# EAGLE design RS232 rev3 (EAGLE 7.1.0)
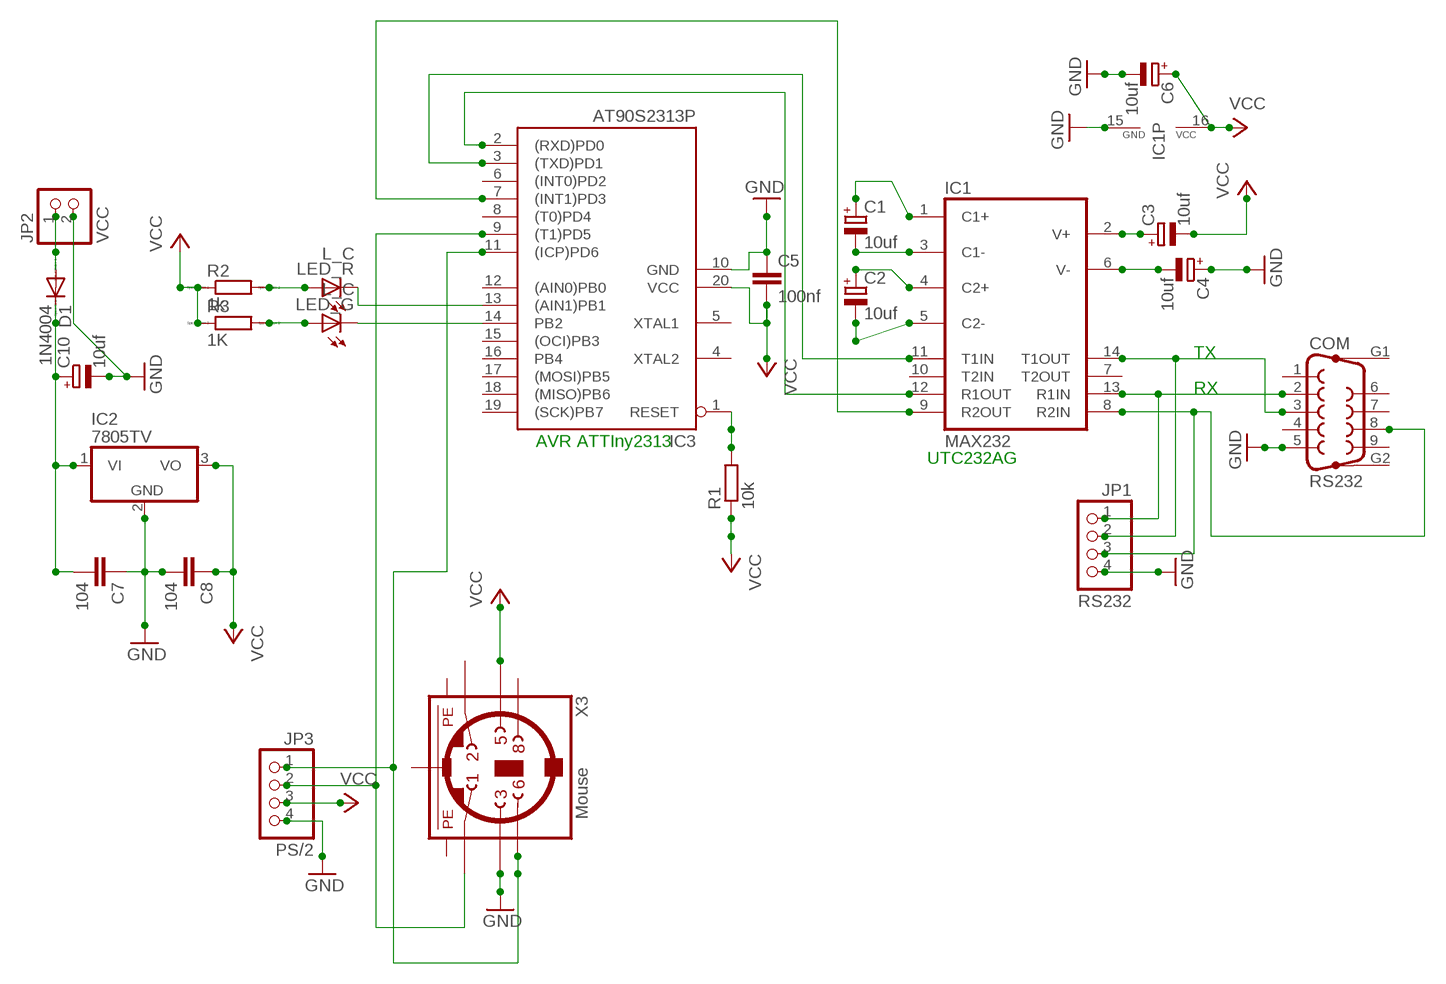
[diagram p0: schematic, sheet 1]

## Parts
C1  10uf  CPOL-EUE2,5-6E  [E2,5-6E]
C2  10uf  CPOL-EUE2,5-6E  [E2,5-6E]
C3  10uf  CPOL-EUE2,5-6E  [E2,5-6E]
C4  10uf  CPOL-EUE2,5-6E  [E2,5-6E]
C5  100nf  C2,5-3  [C2.5-3]
C6  10uf  CPOL-EUE2,5-6E  [E2,5-6E]
C7  104  C-EU025-025X050  [C025-025X050]
C8  104  C-EU025-025X050  [C025-025X050]
C10  10uf  CPOL-EUE2,5-6E  [E2,5-6E]
COM  RS232  F09HP  [F09HP]
D1  1N4004  [DO41-10]
IC1  MAX232  [DIL16]
IC2  7805TV  [TO220V]
IC3  AT90S2313P  [DIL20]
JP1  RS232  PINHD-1X4  [1X04]
JP2  VCC  PINHD-1X2  [1X02]
JP3  PS/2  PINHD-1X4  [1X04]
LED_G  L_C  LED3MM  [LED3MM]
LED_R  L_C  LED3MM  [LED3MM]
R1  10k  R-EU_0207/7  [0207/7]
R2  1k  R-EU_0309_V  [0309V]
R3  1K  R-EU_0309_V  [0309V]
X3  Mouse  MINI_DIN_6  [M_DIN6]

## Nets
GND: C4.+ C5.1 C6.- C7.1 C8.2 C10.- COM.5 IC1.15(GND) IC2.2(GND) IC3.10(GND) JP1.4 JP2.2 JP3.4 X3.3
N$1: IC1.11(T1IN) IC3.3((TXD)PD1)
N$2: IC1.12(R1OUT) IC3.2((RXD)PD0)
N$3: C1.- IC1.3(C1-)
N$4: C1.+ IC1.1(C1+)
N$5: C2.+ IC1.4(C2+)
N$6: C2.- IC1.5(C2-)
N$7: IC3.1(RESET) R1.2
N$8: IC3.11((ICP)PD6) JP3.1 X3.6
N$10: C7.2 C10.+ D1.C IC2.1(VI)
N$11: IC1.9(R2OUT) IC3.7((INT1)PD3)
N$13: IC3.14(PB2) LED_G.K(C)
N$14: C4.- IC1.6(V-)
N$15: C3.+ IC1.2(V+)
N$16: IC3.13((AIN1)PB1) LED_R.K(C)
N$17: COM.2 IC1.13(R1IN) JP1.1
N$18: COM.3 IC1.14(T1OUT) JP1.2
N$20: LED_G.A R3.2
N$21: LED_R.A R2.2
N$22: IC3.9((T1)PD5) JP3.2 X3.1
POWER: D1.A JP2.1
SERIAL#: COM.8 IC1.8(R2IN) JP1.3
VCC: C3.- C5.2 C6.+ C8.1 IC1.16(VCC) IC2.3(VO) IC3.20(VCC) JP3.3 R1.1 R2.1 R3.1 X3.5
Unconnected: COM.1 COM.4 COM.6 COM.7 COM.9 COM.G1 COM.G2 IC1.7(T2OUT) IC1.10(T2IN) IC3.4(XTAL2) IC3.5(XTAL1) IC3.6((INT0)PD2) IC3.8((T0)PD4) IC3.12((AIN0)PB0) IC3.15((OCI)PB3) IC3.16(PB4) IC3.17((MOSI)PB5) IC3.18((MISO)PB6) IC3.19((SCK)PB7) X3.2 X3.8

## Notes on the sheet
- TX
- RX
- AVR ATTIny2313
- UTC232AG

## Power pins joined to a net without a drawn wire
PE1: X3.SH1(PE1)
PE2: X3.SH2(PE2)
PE3: X3.SH3(PE3)

## Library data of the parts
C1-C4 C6 C10 = resistor:CPOL-EU: POLARIZED CAPACITOR, European symbol
C5 = capacitor-wima:C: CAPACITOR naming: grid - package width
C7 C8 = rcl:C-EU: CAPACITOR, European symbol
COM = con-subd:F09HP: SUB-D; OC_FARNELL: unknown; OC_NEWARK: unknown
D1 = diode:1N4004: DIODE general purpose rectifier, 1 A
IC1 = maxim:MAX232: RS232 TRANSCEIVER; MF: MAXIM; MPN: MAX232ACPE+; OC_FARNELL: 9723773; OC_NEWARK: 68K4544
IC2 = linear:78*: Positive VOLTAGE REGULATOR Source: http://cache.national.com/ds/LM/LM78L05.pdf http://www.fairchildsemi.com/ds/LM/LM7805.pdf
IC3 = atmel:AT90S2313: MICROCONTROLLER 2 Kbytes FLASH 128 bytes SRAM 128 bytes EEPROM UART; OC_FARNELL: unknown; OC_NEWARK: unknown
JP1 JP3 = pinhead:PINHD-1X4: PIN HEADER
JP2 = pinhead:PINHD-1X2: PIN HEADER
LED_G LED_R = led:LED: LED OSRAM: - CHIPLED LG R971, LG N971, LY N971, LG Q971, LY Q971, LO R971, LY R971 LH N974, LH R974 LS Q976, LO Q976, LY Q976 LO Q996 - Hyper CHIPLED LW Q18S LB Q993, LB Q99A, LB R99A - SideLED LS A670, LO A670, LY A670, LG A670, LP A670 LB A673, LV A673, LT A673, LW A673 LH A674 LY A675 LS A676, LA A676, LO A676, LY A676, LW A676 LS A679, LY A679, LG A679 - Hyper Micro SIDELED® LS Y876, LA Y876, LO Y876, LY Y876 LT Y87S - SmartLED LW L88C, LW L88S LB L89C, LB L89S, LG L890 LS L89K, LO L89K, LY L89K LS L896, LA L896, LO L896, LY L896 - TOPLED LS T670, LO T670, LY T670, LG T670, LP T670 LSG T670, LSP T670, LSY T670, LOP T670, LYG T670 LG T671, LOG T671, LSG T671 LB T673, LV T673, LT T673, LW T673 LH T674 LS T676, LA T676, LO T676, LY T676, LB T676, LH T676, LSB T676, LW T676 LB T67C, LV T67C, LT T67C, LS T67K, LO T67K, LY T67K, LW E67C LS E67B, LA E67B, LO E67B, LY E67B, LB E67C, LV E67C, LT E67C LW T67C LS T679, LY T679, LG T679 LS T770, LO T770, LY T770, LG T770, LP T770 LB T773, LV T773, LT T773, LW T773 LH T774 LS E675, LA E675, LY E675, LS T675 LS T776, LA T776, LO T776, LY T776, LB T776 LHGB T686 LT T68C, LB T68C - Hyper Mini TOPLED® LB M676 - Mini TOPLED Santana® LG M470 LS M47K, LO M47K, LY M47K Source: http://www.osram.convergy.de LUXEON: - LUMILED® LXK2-PW12-R00, LXK2-PW12-S00, LXK2-PW14-U00, LXK2-PW14-V00 LXK2-PM12-R00, LXK2-PM12-S00, LXK2-PM14-U00 LXK2-PE12-Q00, LXK2-PE12-R00, LXK2-PE12-S00, LXK2-PE14-T00, LXK2-PE14-U00 LXK2-PB12-K00, LXK2-PB12-L00, LXK2-PB12-M00, LXK2-PB14-N00, LXK2-PB14-P00, LXK2-PB14-Q00 LXK2-PR12-L00, LXK2-PR12-M00, LXK2-PR14-Q00, LXK2-PR14-R00 LXK2-PD12-Q00, LXK2-PD12-R00, LXK2-PD12-S00 LXK2-PH12-R00, LXK2-PH12-S00 LXK2-PL12-P00, LXK2-PL12-Q00, LXK2-PL12-R00 Source: www.luxeon.com KINGBRIGHT: KA-3528ASYC Source: www.kingbright.com
R1 = rcl:R-EU_: RESISTOR, European symbol
R2 R3 = resistor:R-EU_: RESISTOR, European symbol; SPICEPREFIX: R
X3 = mini_din:MINI_DIN_6

## Board
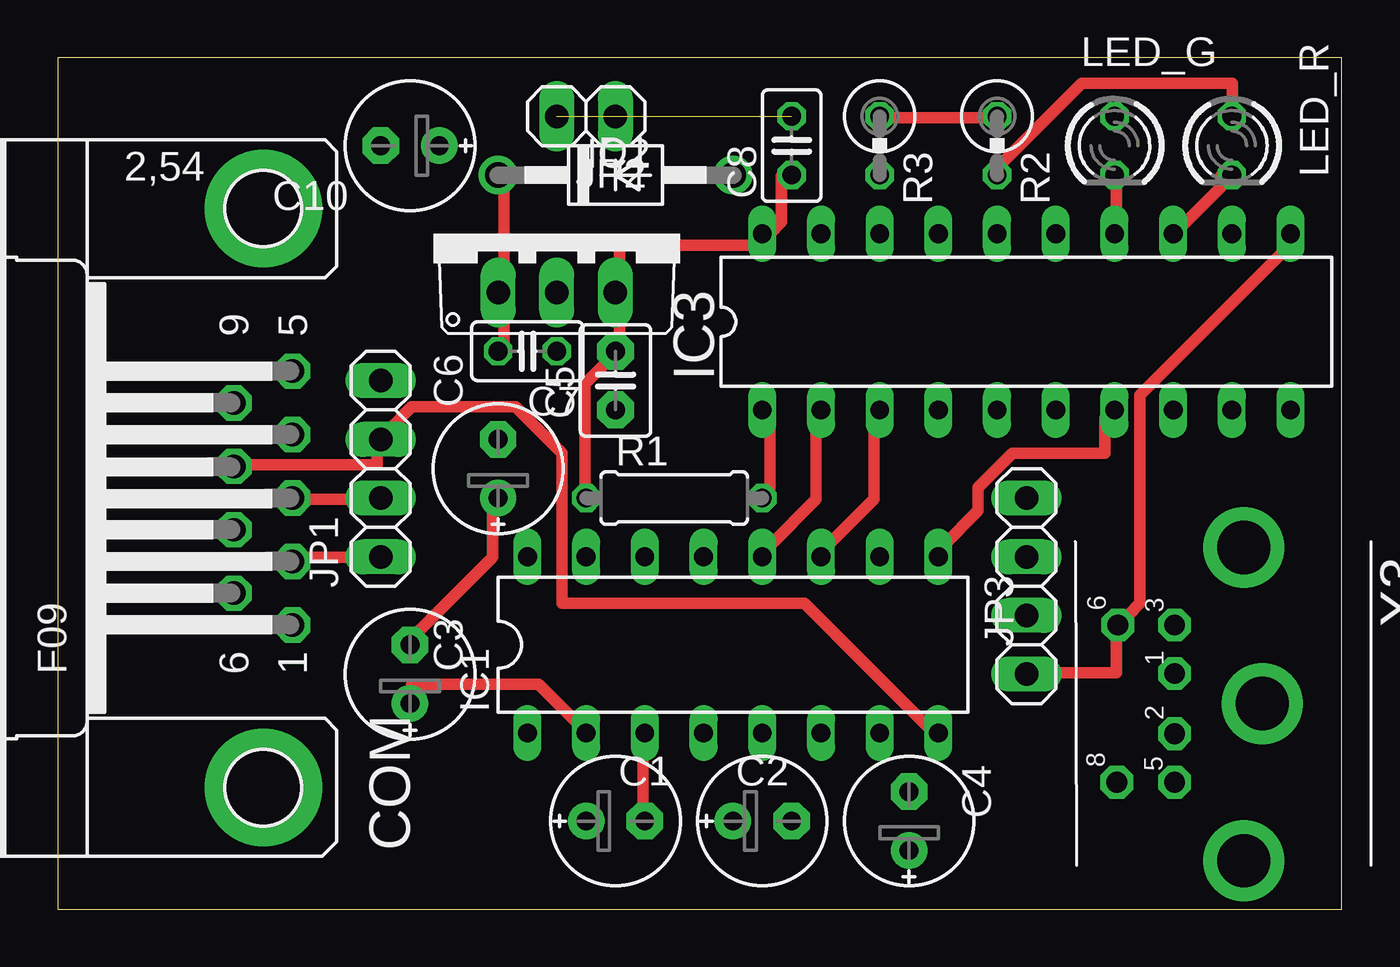
[diagram p1: board, top side]
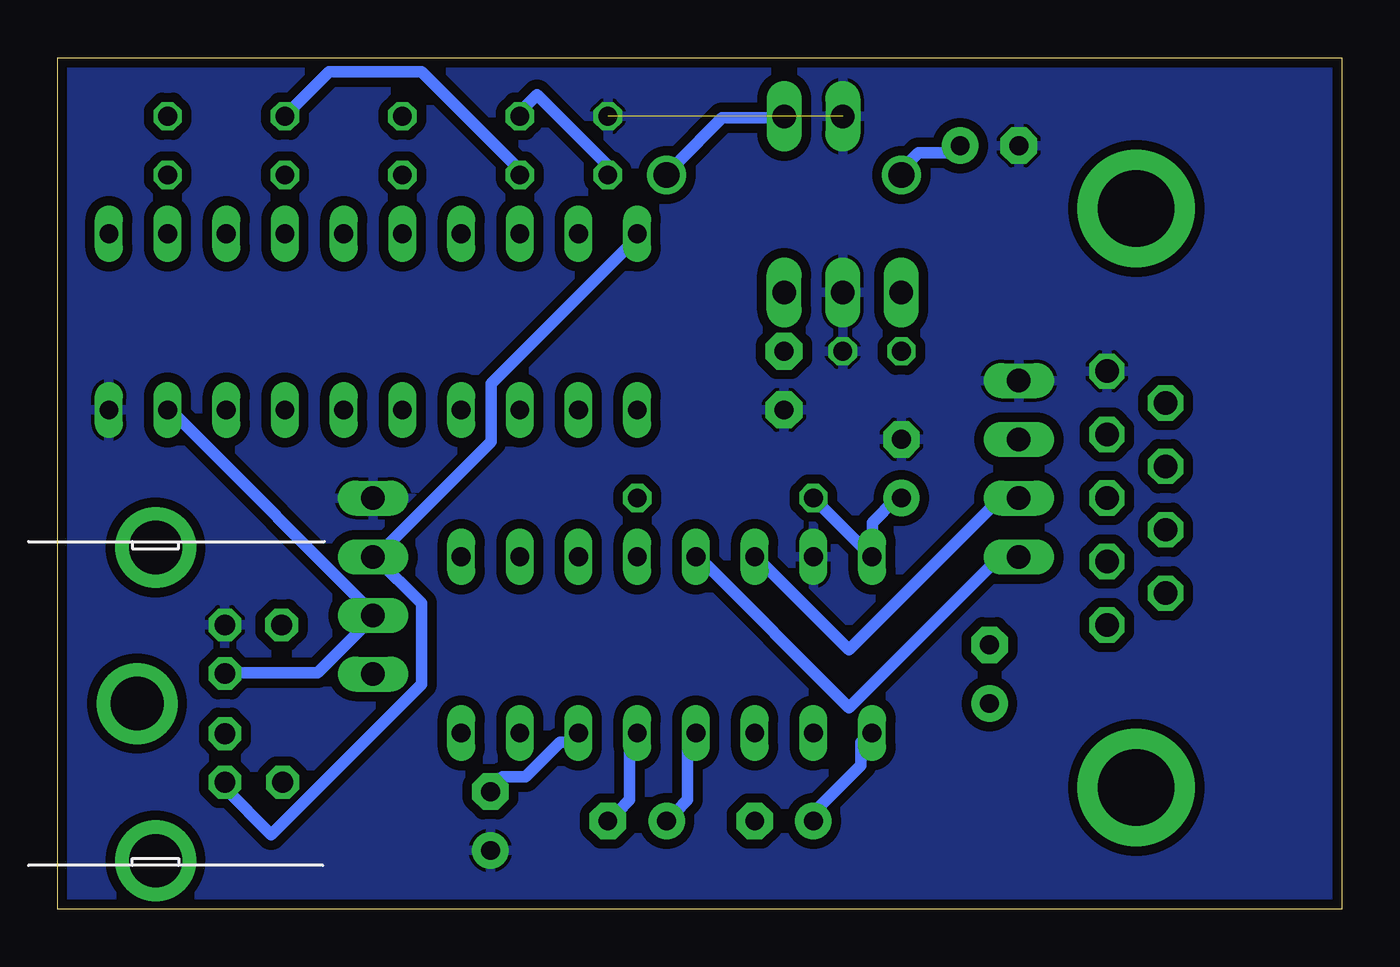
[diagram p2: board, bottom side, seen from below]

Size 55.55 x 36.82 mm. Coordinates in mm from the lower left corner, seen from the top.
Outline: 0,0 55.55,0 55.55,36.82 0,36.82 0,0
Copper layers (1*16): Top 0.035mm / dielectric 1.5mm / Bottom 0.035mm
Design rules "platinensammler_02 *": minimum track width 0.5mm, minimum drill 0.3mm, track to track 0.15mm, track to pad 0.15mm, pad to pad 0.15mm, via to via 0.15mm, smd to smd 0mil, copper to edge 0.2mm, drill to drill 0.2mm, minimum pad ring 0.2mm, minimum via ring 0.2mm, stop-mask expansion 4mil, vias tented up to drill 0.8mm, thermal gap 0.15mm

### Footprints (pad centres in the part's own frame; a part is rotated, then mirrored left to right if it is on the bottom)
E2,5-6E = drill 0.813 pad 1.575: + -1.27,0 | drill 0.813 pad 1.575 octagon: - 1.27,0
C2.5-3 = drill 0.813 pad 1.6 octagon: 1 -1.27,0; 2 1.27,0
C025-025X050 = drill 0.813 octagon: 1 -1.27,0; 2 1.27,0
F09HP = drill 1.016 octagon: 1 -5.486,-1.27; 2 -2.743,-1.27; 3 0,-1.27; 4 2.743,-1.27; 5 5.486,-1.27; 6 -4.115,1.27; 7 -1.372,1.27; 8 1.372,1.27; 9 4.115,1.27 | drill 3.302 pad 5.08: G1 -12.522,0; G2 12.522,0
DO41-10 = drill 1.118: A 5.08,0; C -5.08,0
DIL16 = drill 0.813 long: 1 -8.89,-3.81; 2 -6.35,-3.81; 3 -3.81,-3.81; 4 -1.27,-3.81; 5 1.27,-3.81; 6 3.81,-3.81; 7 6.35,-3.81; 8 8.89,-3.81; 9 8.89,3.81; 10 6.35,3.81; 11 3.81,3.81; 12 1.27,3.81; 13 -1.27,3.81; 14 -3.81,3.81; 15 -6.35,3.81; 16 -8.89,3.81
TO220V = drill 1.016 long: 1 -2.54,-2.54; 2 0,-2.54; 3 2.54,-2.54
DIL20 = drill 0.813 long: 1 -11.43,-3.81; 2 -8.89,-3.81; 3 -6.35,-3.81; 4 -3.81,-3.81; 5 -1.27,-3.81; 6 1.27,-3.81; 7 3.81,-3.81; 8 6.35,-3.81; 9 8.89,-3.81; 10 11.43,-3.81; 11 11.43,3.81; 12 8.89,3.81; 13 6.35,3.81; 14 3.81,3.81; 15 1.27,3.81; 16 -1.27,3.81; 17 -3.81,3.81; 18 -6.35,3.81; 19 -8.89,3.81; 20 -11.43,3.81
1X04 = drill 1.016 long: 1 -3.81,0; 2 -1.27,0; 3 1.27,0; 4 3.81,0
1X02 = drill 1.016 long: 1 -1.27,0; 2 1.27,0
LED3MM = drill 0.813 octagon: A -1.27,0; K 1.27,0
0207/7 = drill 0.813 octagon: 1 -3.81,0; 2 3.81,0
0309V = drill 0.813 octagon: 1 -1.27,0; 2 1.27,0
M_DIN6 = drill 0.9 pad 1.422 octagon: 1 -1.3,-3.75; 2 1.3,-3.75; 3 -3.4,-3.75; 5 3.4,-3.75; 6 -3.4,-6.2; 8 3.4,-6.25 | drill 2.3 pad 3.5: SH1 6.8,-0.75; SH2 0,0.05; SH3 -6.75,-0.75

### Placement (x,y rotation side)
C1  24.13,3.81 0 top
C2  30.48,3.81 0 top
C3  15.24,10.16 90 top
C4  36.83,3.81 90 top
C5  24.13,22.86 90 top
C6  19.05,19.05 90 top
C7  20.32,24.13 180 top
C8  31.75,33.02 90 top
C10  15.24,33.02 180 top
COM  8.89,17.78 90 top
D1  24.13,31.75 0 top
IC1  29.21,11.43 0 top
IC2  21.59,29.21 0 top
IC3  41.91,25.4 0 top
JP1  13.97,19.05 90 top
JP2  22.86,34.29 180 top
JP3  41.91,13.97 90 top
LED_G  45.72,33.02 270 top
LED_R  50.8,33.02 270 top
R1  26.67,17.78 0 top
R2  40.64,33.02 270 top
R3  35.56,33.02 270 top
X3  52.07,8.89 270 top

### Tracks (layer width: path | path; a pad name or v marks a point on that pad's centre or on a via)
GND  (1 unrouted)
  pour Bottom (isolate 0.406): 0,36.83 0,0 55.88,0 55.88,36.83
N$1
  Top 0.5: IC1.11 33.31,15.72 35.31,17.72 35.31,21.22 IC3.3
N$2
  Top 0.5: IC1.12 30.81,15.72 32.81,17.72 32.81,21.22 IC3.2
N$3
  Top 0.5: IC1.3 25.31,7.22 25.31,4.22 C1.-
N$4
  Bottom 0.5: IC1.1 20.81,7.22 20.81,6.22 22.81,4.22 C1.+
N$5
  Bottom 0.5: IC1.4 28.31,7.22 28.31,4.72 28.81,4.22 C2.+
N$6
  Bottom 0.5: IC1.5 30.81,7.22 30.81,4.72 31.31,4.22 C2.-
N$7
  Top 0.5: R1.2 30.81,18.22 30.81,21.22 IC3.1
N$8
  Top 0.5: IC3.11 53.31,28.72 46.81,22.22 46.81,13.22 46.31,12.72 X3.6 45.81,12.22 45.81,10.22 42.31,10.22 JP3.1
N$10
  Top 0.5: C7.2 19.31,24.22 19.31,26.22 IC2.1 19.31,26.72 19.31,31.72 D1.C
  Bottom 0.5: C10.+ 16.81,32.72 18.31,32.72 18.81,32.22 D1.C
N$11
  Top 0.5: IC1.9 38.31,15.72 39.81,17.22 39.81,18.22 41.31,19.72 45.31,19.72 45.31,21.22 IC3.7
N$13
  Top 0.5: IC3.14 45.81,29.22 45.81,31.72 LED_G.K
N$14
  Bottom 0.5: IC1.6 33.31,7.22 33.81,7.22 35.31,5.72 36.31,5.72 36.81,5.22 C4.-
N$15
  Top 0.5: IC1.2 22.81,7.72 20.81,9.72 15.31,9.72 15.31,9.22 C3.+
N$16
  Top 0.5: IC3.13 48.31,29.22 50.31,31.22 50.31,31.72 LED_R.K
N$17
  Top 0.5: COM.2 10.31,15.22 13.81,15.22 JP1.1
  Bottom 0.5: IC1.13 27.81,15.22 21.31,8.72 14.31,15.72 JP1.1
N$18
  Top 0.5: COM.3 10.31,17.72 13.81,17.72 JP1.2
  Bottom 0.5: IC1.14 25.31,15.22 21.31,11.22 14.31,18.22 JP1.2
N$20
  Bottom 0.5: R3.2 35.81,32.22 39.81,36.22 43.81,36.22 45.31,34.72 LED_G.A
N$21
  Top 0.5: R2.2 40.81,32.22 44.31,35.72 50.81,35.72 50.81,34.72 LED_R.A
N$22
  Bottom 0.5: IC3.9 50.31,21.22 41.81,12.72 JP3.2 42.31,12.22 44.31,10.22 48.31,10.22 X3.1
POWER
  Bottom 0.5: JP2.1 24.31,34.22 26.81,34.22 28.81,32.22 D1.A
SERIAL#
  Top 0.5: IC1.8 37.81,7.72 32.31,13.22 21.81,13.22 21.81,19.72 19.81,21.72 15.31,21.72 14.31,20.72 JP1.3 13.81,20.22 13.81,19.22 7.81,19.22 COM.8
VCC
  Top 0.5: C8.1 31.31,31.72 31.31,29.72 30.81,29.22 IC3.20 30.31,28.72 24.31,28.72 24.31,26.72 IC2.3 24.31,26.22 24.31,24.22 C5.2 23.81,23.72 22.81,22.72 22.81,18.22 R1.1 | R3.1 35.81,34.22 40.31,34.22 R2.1 | C3.- 15.31,11.72 18.81,15.22 18.81,17.72 C6.+
  Bottom 0.5: X3.5 48.31,5.22 46.31,3.22 39.81,9.72 39.81,13.22 41.81,15.22 JP3.3 41.81,15.72 41.31,15.72 36.81,20.22 36.81,22.72 30.81,28.72 IC3.20 | C8.1 31.81,32.22 34.81,35.22 35.31,34.72 R3.1 | C6.+ 19.31,17.72 20.31,16.72 20.31,15.72 IC1.16 20.81,15.72 22.81,17.72 R1.1